# Altium schematic sheet Zegar.SchDoc
size A3
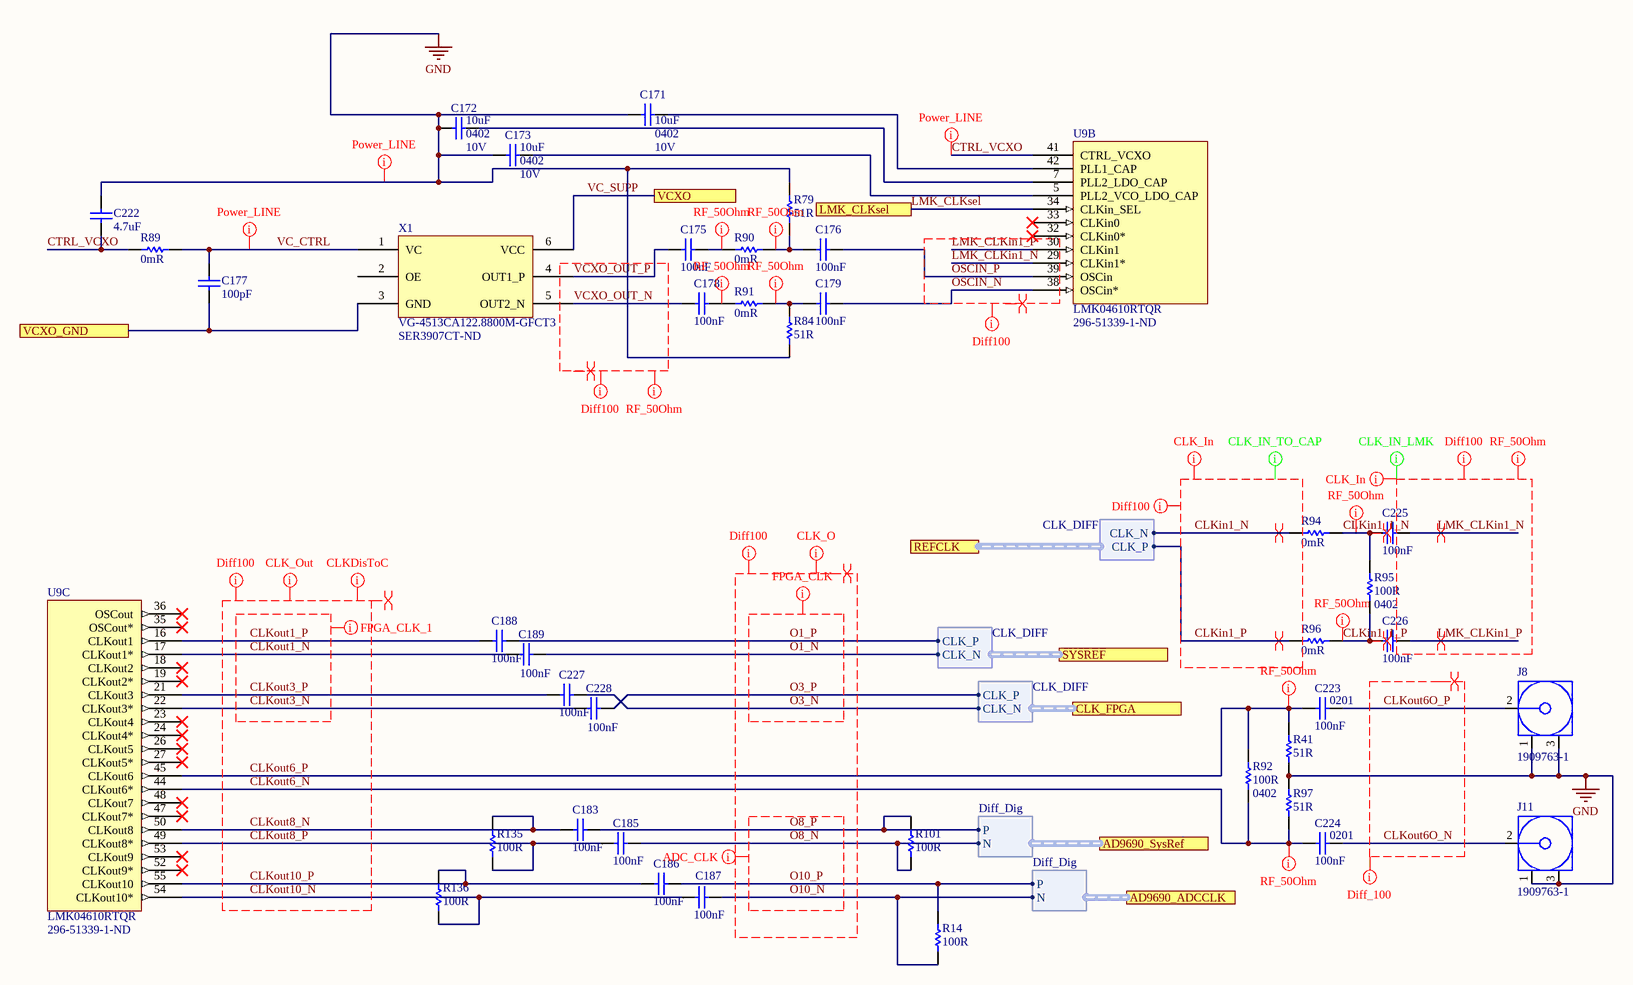
[diagram p0: Zegar.SchDoc]

## Parts
C171  10uF  Case/Package: 0402  Voltage Rating: 10V  [CAP 0402/1005 RF KK]
C172  10uF  Case/Package: 0402  Voltage Rating: 10V  [CAP 0402/1005 RF KK]
C173  10uF  Case/Package: 0402  Voltage Rating: 10V  [CAP 0402/1005 RF KK]
C175  100nF  [CAP 0201/0603 KK]
C176  100nF  [CAP 0201/0603 KK]
C177  100pF  [CAP 0402/1005 RF KK]
C178  100nF  [CAP 0201/0603 KK]
C179  100nF  [CAP 0201/0603 KK]
C183  100nF  [CAP 0201/0603 KK]
C185  100nF  [CAP 0201/0603 KK]
C186  100nF  [CAP 0201/0603 KK]
C187  100nF  [CAP 0201/0603 KK]
C188  100nF  [CAP 0201/0603 KK]
C189  100nF  [CAP 0201/0603 KK]
C222  4.7uF  [CAP 0603/1608 RF]
C223  100nF  Case Code (Imperial): 0201  [CAP 0201/0603 KK]
C224  100nF  Case Code (Imperial): 0201  [CAP 0201/0603 KK]
C225  100nF  [CAP 0201/0603 KK]
C226  100nF  [CAP 0201/0603 KK]
C227  100nF  [CAP 0201/0603 KK]
C228  100nF  [CAP 0201/0603 KK]
J8  1909763-1  [TECO-1909763-1_V]
J11  1909763-1  [TECO-1909763-1_V]
R14  100R  [RES 0201/0603]
R41  51R  [RES 0402/1005 RF KK]
R79  51R  [RES 0402/1005 RF KK]
R84  51R  [RES 0402/1005 RF KK]
R89  0mR  [RES 0402/1005 RF KK]
R90  0mR  [RES 0402/1005 RF KK]
R91  0mR  [RES 0402/1005 RF KK]
R92  100R  Case/Package: 0402  [RES 0402/1005 RF KK]
R94  0mR  [RES 0402/1005 RF KK]
R95  100R  Case/Package: 0402  [RES 0402/1005 RF KK]
R96  0mR  [RES 0402/1005 RF KK]
R97  51R  [RES 0402/1005 RF KK]
R101  100R  [RES 0201/0603]
R135  100R  [RES 0201/0603]
R136  100R  [RES 0201/0603]
U9  LMK04610RTQR  Supplier Part Number 1: 296-51339-1-ND  [LMK04610]  (parts B,C of 4)
X1  VG-4513CA122.8800M-GFCT3  Supplier Part Number 1: SER3907CT-ND  [VG-4513CA]

## Ports
AD9690_ADCCLK (harness Diff_Dig), AD9690_SysRef (harness Diff_Dig), CLK_FPGA (harness CLK_DIFF), LMK_CLKsel, REFCLK (harness CLK_DIFF), SYSREF (harness CLK_DIFF), VCXO, VCXO_GND

## Harnesses
Diff_Dig: P, N
CLK_DIFF: CLK_P, CLK_N

## Nets
GND: C171.2 C172.2 C173.2 C222.2 J8.1 J8.3 J11.1 J11.3 R41.1 R79.2 R84.1 R97.1
CLKin1_1_N: C225.1 R94.2 R95.1
CLKin1_1_P: C226.1 R95.2 R96.2
CLKin1_N: R94.1 ; port REFCLK.CLK_N
CLKin1_P: R96.1 ; port REFCLK.CLK_P
CLKout1_N: C189.1 U9.17(CLKout1*)
CLKout1_P: C188.1 U9.16(CLKout1)
CLKout3_N: C228.1 U9.22(CLKout3*)
CLKout3_P: C227.1 U9.21(CLKout3)
CLKout6_N: C224.1 R92.2 R97.2 U9.44(CLKout6*)
CLKout6_P: C223.1 R41.2 R92.1 U9.45(CLKout6)
CLKout6O_N: C224.2 J11.2
CLKout6O_P: C223.2 J8.2
CLKout8_N: C183.1 R135.2 U9.50(CLKout8)
CLKout8_P: C185.1 R135.1 U9.49(CLKout8*)
CLKout10_N: C187.1 R136.1 U9.54(CLKout10*)
CLKout10_P: C186.1 R136.2 U9.55(CLKout10)
CTRL_VCXO: C222.1 R89.1 U9.41(CTRL_VCXO)
LMK_CLKin1_N: C225.2 U9.29(CLKin1*)
LMK_CLKin1_P: C226.2 U9.30(CLKin1)
LMK_CLKsel: U9.34(CLKin_SEL) ; port LMK_CLKsel
O1_N: C189.2 ; port SYSREF.CLK_N
O1_P: C188.2 ; port SYSREF.CLK_P
O3_N: C227.2 ; port CLK_FPGA.CLK_N
O3_P: C228.2 ; port CLK_FPGA.CLK_P
O8_N: C185.2 R101.1 ; port AD9690_SysRef.N
O8_P: C183.2 R101.2 ; port AD9690_SysRef.P
O10_N: C187.2 R14.1 ; port AD9690_ADCCLK.N
O10_P: C186.2 R14.2 ; port AD9690_ADCCLK.P
OSCIN_N: C179.2 U9.38(OSCin*)
OSCIN_P: C176.2 U9.39(OSCin)
VC_CTRL: C177.2 R89.2 X1.1(VC)
VC_SUPP: X1.6(VCC) ; port VCXO
VCXO_GND: C177.1 X1.3(GND) ; port VCXO_GND
VCXO_OUT_N: C178.1 X1.5(OUT2_N)
VCXO_OUT_P: C175.1 X1.4(OUT1_P)
NetC171_1: C171.1 U9.42(PLL1_CAP)
NetC172_1: C172.1 U9.7(PLL2_LDO_CAP)
NetC173_1: C173.1 U9.5(PLL2_VCO_LDO_CAP)
NetC175_2: C175.2 R90.1
NetC176_1: C176.1 R79.1 R90.2
NetC178_2: C178.2 R91.1
NetC179_1: C179.1 R84.2 R91.2

Not connected (* = marked no-connect by the designer): U9 18(CLKout2)* 19(CLKout2*)* 23(CLKout4)* 24(CLKout4*)* 26(CLKout5)* 27(CLKout5*)* 32(CLKin0*)* 33(CLKin0)* 35(OSCout*)* 36(OSCout)* 47(CLKout7*)* 48(CLKout7)* 52(CLKout9*)* 53(CLKout9)*; X1 2(OE)

## Layout directives
net class CLK_IN1: CLKin1_N, CLKin1_P
net class CLK_IN2: LMK_CLKin1_N, LMK_CLKin1_P
net class CLK_O: O1_N, O1_P, O3_N, O3_P, O8_N, O8_P, O10_N, O10_P
net class ADC_CLK: O8_N, O8_P, O10_N, O10_P
net class Diff_100: CLKin1_N, CLKin1_P, CLKout1_N, CLKout1_P, CLKout3_N, CLKout3_P, CLKout6_N, CLKout6_P, CLKout6O_N, CLKout6O_P, CLKout8_N, CLKout8_P, CLKout10_N, CLKout10_P, LMK_CLKin1_N, LMK_CLKin1_P, O1_N, O1_P, O3_N, O3_P, O8_N, O8_P, O10_N, O10_P, OSCIN_N, OSCIN_P, VCXO_OUT_N, VCXO_OUT_P
net class CLK_Out: CLKout1_N, CLKout1_P, CLKout3_N, CLKout3_P, CLKout6_N, CLKout6_P, CLKout8_N, CLKout8_P, CLKout10_N, CLKout10_P
net class CLKDisToC: CLKout1_N, CLKout1_P, CLKout3_N, CLKout3_P, CLKout6_N, CLKout6_P, CLKout8_N, CLKout8_P, CLKout10_N, CLKout10_P
net class Power_LINE: CTRL_VCXO, GND, VC_CTRL
net class CLK_IN_TO_CAP: CLKin1_N, CLKin1_P
net class CLK_IN_LMK: LMK_CLKin1_N, LMK_CLKin1_P
differential pair; differential pair class Diff_100: CLKin1_1_N, CLKin1_1_P, CLKin1_N, CLKin1_P, CLKout1_N, CLKout1_P, CLKout3_N, CLKout3_P, CLKout6_N, CLKout6_P, CLKout6O_N, CLKout6O_P, CLKout8_N, CLKout8_P, CLKout10_N, CLKout10_P, LMK_CLKin1_N, LMK_CLKin1_P, O1_N, O1_P, O3_N, O3_P, O8_N, O8_P, O10_N, O10_P, OSCIN_N, OSCIN_P, VCXO_OUT_N, VCXO_OUT_P
net class FPGA_CLK: O1_N, O1_P, O3_N, O3_P
net class Single50: CLKin1_1_N, CLKin1_1_P, CLKout6_N, CLKout6_P, LMK_CLKin1_N, LMK_CLKin1_P, NetC175_2, NetC176_1, NetC178_2, NetC179_1, VCXO_OUT_N, VCXO_OUT_P
net class FPGA_CLK_1: CLKout1_N, CLKout1_P, CLKout3_N, CLKout3_P

## Notes on the sheet
- Title
- Size:
- Date:
- A3
- Number:
- Time:
- Revision:
- Sheet
- of
- File:

## Library data of the parts
C171-C173 = Capacitor: CAP CER 10UF 10V X5R 0402; Manufacturer: Samsung; Manufacturer Part Number: CL05A106MP8NUB8; Tolerance: 20%; Supplier 1: Digi-Key; Supplier Part Number 1: 1276-6830-1-ND; RoHS: Yes; Category: Ceramic Capacitors; Stock 1: 1457006; Pricing 1: 1=0,40000, 10=0,27900, 50=0,19500, 100=0,16710, 500=0,12534, 1000=0,10584, 2500=0,10027 (USD); Mount: Surface Mount; Case Code (Metric): 1005; Case Code (Imperial): 0402; Min Operating Temperature: -55°C; Max Operating Temperature: 85°C; Packaging: Tape and Reel; Capacitance: 10uF; Length: 0.039inch; Width: 0.02inch; Thickness: 0.035inch; ComponentLink1URL: http://www.samsungsem.com/kr/support/product-search/mlcc/CL05A106MP8NUB8.jsp?src-supplier=Digi-Key; ComponentLink1Description: http://www.samsungsem.com/kr/support/product-search/mlcc/CL05A106MP8NUB8.jsp?src-supplier=Digi-Key
C175 C176 C178 C179 C183 C185-C189 C223-C228 = Capacitor: Manufacturer 1: Yageo; Manufacturer Part Number 1: CC0201KRX5R6BB104; Voltage Rating (DC): 10V; Tolerance: 10%; Dielectric: X5R; Supplier 1: Digi-Key; Supplier Part Number 1: 311-1593-1-ND; Stock 1: 1229391; Pricing 1: 1=0.10000, 10=0.03800, 100=0.01690, 500=0.01208, 1000=0.00949, 2500=0.00862, 5000=0.00794 (USD); RoHS: Yes; Mount: Surface Mount; Case/Package: 0201; Weight: 6E-06oz; Case Code (Metric): 0603; Min Operating Temperature: -55°C; Max Operating Temperature: 85°C; Capacitance: 100nF; Packaging: Tape and Reel; Termination: SMD/SMT; Composition: Ceramic; Voltage Rating: 10V; Length: 0.6mm; Height: 0.3mm; Width: 0.012inch; Thickness: 0.013inch; Depth: 0.3mm; Radiation Hardening: No; Lead Free: Lead Free; Halogen Free: Halogen Free; ComponentLink1URL: https://datasheet.ciiva.com/17437/upy-gphc-x5r-4v-to-50v-12-17437495.pdf?src-supplier=Avnet+Europe; ComponentLink1Description: https://datasheet.ciiva.com/17437/upy-gphc-x5r-4v-to-50v-12-17437495.pdf?src-supplier=Avnet+Europe; ComponentLink2URL: https://datasheet.ciiva.com/11587/upy-gphc-x5r-4v-to-50v-12-11587190.pdf?src-supplier=Avnet; ComponentLink2Description: https://datasheet.ciiva.com/11587/upy-gphc-x5r-4v-to-50v-12-11587190.pdf?src-supplier=Avnet
  C175 C176 C178 C179 C183 C185-C189 C225-C228: Case Code (Imperial): 0201
C177 = Capacitor: Manufacturer 1: KEMET; Manufacturer Part Number 1: C0402C101J5GACAUTO; Dielectric Material: Ceramic; Tolerance: 5%; Voltage Rating: 50V; Dielectric: C0G; Supplier 1: Digi-Key; Supplier Part Number 1: 399-6823-1-ND; Stock 1: 66452; Pricing 1: 1=0.11000, 10=0.08400, 100=0.03730, 500=0.02664, 1000=0.02093, 2500=0.01903, 5000=0.01751 (USD); RoHS: Yes; Mount: Surface Mount; Case/Package: 0402; Case Code (Metric): 1005; Case Code (Imperial): 0402; Min Operating Temperature: -55°C; Max Operating Temperature: 125°C; Package Quantity: 10000; Capacitance: 100pF; Packaging: Tape and Reel; Voltage Rating (DC): 50V; Length: 1mm; Width: 0.02inch; Thickness: 0.022inch; Depth: 0.5mm; Ratings: AEC-Q200; Radiation Hardening: No; REACH SVHC: No SVHC; Lead Free: Lead Free; ComponentLink1URL: https://datasheet.ciiva.com/26923/getdatasheetpartid-385375-26923866.pdf?src-supplier=Verical; ComponentLink1Description: https://datasheet.ciiva.com/26923/getdatasheetpartid-385375-26923866.pdf?src-supplier=Verical
C222 = Capacitor: Manufacturer 1: Samsung; Manufacturer Part Number 1: CL10A475KQ8NNNC; Material: Ceramic; Tolerance: 20%; Voltage Rating: 6.3V; Dielectric: X5R; Supplier 1: Digi-Key; Supplier Part Number 1: 1276-1045-1-ND; Stock 1: 3419762; Pricing 1: 1=0.10000, 10=0.05500, 100=0.02450, 500=0.01750, 1000=0.01375 (USD); RoHS: Yes; Mount: Surface Mount; Case/Package: 0603; Case Code (Metric): 1608; Case Code (Imperial): 0603; Contact Plating: Tin; Min Operating Temperature: -55°C; Max Operating Temperature: 85°C; Capacitance: 4.7uF; Packaging: Tape and Reel; Package Quantity: 1; Voltage: 6.3V; Length: 1.6mm; Height: 0.8mm; Width: 0.031inch; Thickness: 0.035inch; Depth: 0.8mm; Radiation Hardening: No; ComponentLink1URL: https://datasheet.ciiva.com/15195/getdatasheetpartid-358620-15195714.pdf?src-supplier=Verical; ComponentLink1Description: https://datasheet.ciiva.com/15195/getdatasheetpartid-358620-15195714.pdf?src-supplier=Verical; ComponentLink2URL: https://datasheet.ciiva.com/29198/457675-da-01-en-vs-kondensator-0603-29198672.pdf?src-supplier=Conrad; ComponentLink2Description: https://datasheet.ciiva.com/29198/457675-da-01-en-vs-kondensator-0603-29198672.pdf?src-supplier=Conrad; ComponentLink3URL: https://datasheet.ciiva.com/16437/cl05b104kq5nnnc-16437321.pdf?src-supplier=Future+Electronics; ComponentLink3Description: https://datasheet.ciiva.com/16437/cl05b104kq5nnnc-16437321.pdf?src-supplier=Future+Electronics
J8 J11 = 1909763-1: Ultra Miniature Coaxial Connector Jack, 60 V, 50 Ohm, -40 to 90 degC, RoHS, Tape and Reel; Brand: TE Connectivity / AMP; Maximum Frequency: 6 GHz; Gender: Jack (Female); Body Material: Liquid Crystal Polymer (LCP); RF Series: UMCC; Impedance: 50 Ohms; DatasheetVersion: Rev. B2; PackageReference: SMD; PackageDescription: 3-Pin Surface Mount Device, Body 2.6 x 2.6 mm; Supplier 1: Newark; Supplier Part Number 1: 62X0488; Supplier 2: Farnell; Supplier Part Number 2: 2781689; Supplier 3: Digi-Key; Supplier Part Number 3: A118077TR-ND; Supplier 4: Digi-Key; Supplier Part Number 4: A118077CT-ND; Supplier 5: Digi-Key; Supplier Part Number 5: A118077DKR-ND; Product Category: RF Connectors / Coaxial Connectors; Packaging: Reel; Product: Connectors; Orientation: Straight; Operating Temperature Range: - 40 C to + 90 C; Factory Pack Quantity: 5000; RoHS: Details; Contact Plating: Gold; Contact Material: Copper Alloy; Mounting Technology: Surface Mount; ComponentLink1Description: Manufacturer URL; ComponentLink1URL: http://www.te.com; ComponentLink2Description: Datasheet; ComponentLink2URL: http://www.te.com/commerce/DocumentDelivery/DDEController?Action=srchrtrv&DocNm=1909763&DocType=Customer+Drawing&DocLang=English
R14 R101 R135 R136 = Resistor: Manufacturer 1: Panasonic; Manufacturer Part Number 1: ERJ-1GEF1000C; Tolerance: 1%; Power Rating: 50mW; Voltage Rating: 25V; Temperature Coefficient: 200ppm/°C; Voltage Rating (DC): 15V; Supplier 1: Mouser; Supplier Part Number 1: 667-ERJ-1GEF1000C; Stock 1: 517; Pricing 1: 1=0.10000, 10=0.03100, 100=0.01400, 1000=0.01000, 5000=0.00700, 10000=0.00600 (USD); RoHS: Yes; Mount: Surface Mount; Case/Package: 0201; Case Code (Metric): 0603; Case Code (Imperial): 0201; Contact Plating: Tin; Min Operating Temperature: -55°C; Max Operating Temperature: 125°C; Resistance: 100R; Packaging: Tape and Reel; Package Quantity: 15000; Composition: Thick Film; Number of Terminations: 2; Termination: SMD/SMT; Military Standard: Not; Max Power Dissipation: 50mW; Length: 0.6mm; Height: 0.23mm; Width: 0.012inch; Depth: 0.3mm; REACH SVHC: Unknown; Lead Free: Lead Free; ComponentLink1URL: https://datasheet.ciiva.com/16427/erj-1gef1000c-16427637.pdf?src-supplier=Future+Electronics; ComponentLink1Description: https://datasheet.ciiva.com/16427/erj-1gef1000c-16427637.pdf?src-supplier=Future+Electronics; ComponentLink2URL: https://datasheet.ciiva.com/16766/70260683-16766261.pdf?src-supplier=Allied+Electronics; ComponentLink2Description: https://datasheet.ciiva.com/16766/70260683-16766261.pdf?src-supplier=Allied+Electronics; ComponentLink3URL: https://datasheet.ciiva.com/16776/70260683-16776517.pdf?src-supplier=Allied+Electronics; ComponentLink3Description: https://datasheet.ciiva.com/16776/70260683-16776517.pdf?src-supplier=Allied+Electronics; ComponentLink4URL: https://datasheet.ciiva.com/7830/1678796-7830951.pdf?src-supplier=Element14; ComponentLink4Description: https://datasheet.ciiva.com/7830/1678796-7830951.pdf?src-supplier=Element14
R41 R79 R84 R97 = Resistor: Manufacturer 1: Susumu; Manufacturer Part Number 1: RR0510R-510-D; Tolerance: 0.5%; Power Rating: 63mW; Voltage Rating: 25V; Temperature Coefficient: 100ppm/°C; Supplier 1: Digi-Key; Supplier Part Number 1: RR05R51DCT-ND; Stock 1: 85168; Pricing 1: 1=0.10000, 10=0.07400, 100=0.02850, 1000=0.01254, 2500=0.01083, 5000=0.00969 (USD); RoHS: Yes; Case/Package: 0402; Number of Pins: 2; Case Code (Metric): 1005; Case Code (Imperial): 0402; Min Operating Temperature: -55°C; Max Operating Temperature: 125°C; Resistance: 51R; Package Quantity: 1; Packaging: Tape and Reel; Composition: Thin Film; Number of Terminations: 2; Termination: SMD/SMT; Max Power Dissipation: 63mW; Voltage Rating (DC): 25V; Length: 0.039inch; Height: 0.016inch; Width: 0.02inch; REACH SVHC: Unknown; Lead Free: Lead Free; ComponentLink1URL: https://datasheet.ciiva.com/2486/rr-data-sheet-2486920.pdf?src-supplier=Digi-Key; ComponentLink1Description: https://datasheet.ciiva.com/2486/rr-data-sheet-2486920.pdf?src-supplier=Digi-Key; ComponentLink2URL: https://datasheet.ciiva.com/2486/rr-data-sheet-2486921.pdf?src-supplier=Digi-Key; ComponentLink2Description: https://datasheet.ciiva.com/2486/rr-data-sheet-2486921.pdf?src-supplier=Digi-Key; ComponentLink3URL: https://datasheet.ciiva.com/2486/rr-data-sheet-2486922.pdf?src-supplier=Digi-Key; ComponentLink3Description: https://datasheet.ciiva.com/2486/rr-data-sheet-2486922.pdf?src-supplier=Digi-Key; ComponentLink4URL: https://datasheet.ciiva.com/28635/87330-28635919.pdf?src-supplier=Element14; ComponentLink4Description: https://datasheet.ciiva.com/28635/87330-28635919.pdf?src-supplier=Element14
R89-R91 R94 R96 = Resistor: Manufacturer 1: Yageo; Manufacturer Part Number 1: RC0402JR-070RL; Power Rating: 62.5mW; Tolerance: 5%; Voltage Rating: 50V; Max Power Dissipation: 63mW; Temperature Coefficient: 200ppm/°C; Supplier 1: Digi-Key; Supplier Part Number 1: 311-0.0JRCT-ND; Stock 1: 69822252; Pricing 1: 1=0.10000, 10=0.01200, 25=0.00920, 50=0.00680, 100=0.00510, 250=0.00388, 500=0.00308, 1000=0.00227, 5000=0.00163 (USD); RoHS: Yes; Case/Package: 0402; Contact Plating: Tin,Matte; Case Code (Metric): 1005; Case Code (Imperial): 0402; Min Operating Temperature: -55°C; Max Operating Temperature: 155°C; Resistance: 0mR; Packaging: Tape and Reel; Composition: Thick Film; Package Quantity: 1; Number of Terminations: 2; Termination: SMD/SMT; Military Standard: Not; Features: Moisture Resistant; Length: 1mm; Height: 0.016inch; Width: 0.02inch; Depth: 0.5mm; Radiation Hardening: No; REACH SVHC: Unknown; Lead Free: Lead Free; ComponentLink1URL: https://datasheet.ciiva.com/2452/pyu-rc0402-51-rohs-l-6-2452608.pdf?src-supplier=Digi-Key; ComponentLink1Description: https://datasheet.ciiva.com/2452/pyu-rc0402-51-rohs-l-6-2452608.pdf?src-supplier=Digi-Key; ComponentLink2URL: https://datasheet.ciiva.com/11808/0900766b80c66297-11808195.pdf?src-supplier=RSComponents; ComponentLink2Description: https://datasheet.ciiva.com/11808/0900766b80c66297-11808195.pdf?src-supplier=RSComponents; ComponentLink3URL: https://datasheet.ciiva.com/2452/pyu-r-int-thick-7-2452609.pdf?src-supplier=Digi-Key; ComponentLink3Description: https://datasheet.ciiva.com/2452/pyu-r-int-thick-7-2452609.pdf?src-supplier=Digi-Key; ComponentLink4URL: https://datasheet.ciiva.com/22747/1018594-22747515.pdf?src-supplier=Element14; ComponentLink4Description: https://datasheet.ciiva.com/22747/1018594-22747515.pdf?src-supplier=Element14; ComponentLink5URL: https://datasheet.ciiva.com/7983/1018594-7983535.pdf?src-supplier=Element14; ComponentLink5Description: https://datasheet.ciiva.com/7983/1018594-7983535.pdf?src-supplier=Element14; ComponentLink6URL: https://datasheet.ciiva.com/2452/pyu-r-int-thick-7-2452610.pdf?src-supplier=Digi-Key; ComponentLink6Description: https://datasheet.ciiva.com/2452/pyu-r-int-thick-7-2452610.pdf?src-supplier=Digi-Key; ComponentLink7URL: https://datasheet.ciiva.com/8896/pyu-rc0402-51-rohs-l-6-8896201.pdf?src-supplier=Avnet; ComponentLink7Description: https://datasheet.ciiva.com/8896/pyu-rc0402-51-rohs-l-6-8896201.pdf?src-supplier=Avnet; ComponentLink8URL: https://datasheet.ciiva.com/28386/pyu-rc0402-51-rohs-l-6-28386633.pdf?src-supplier=Avnet+Europe; ComponentLink8Description: https://datasheet.ciiva.com/28386/pyu-rc0402-51-rohs-l-6-28386633.pdf?src-supplier=Avnet+Europe; ComponentLink9URL: https://datasheet.ciiva.com/15189/getdatasheetpartid-326379-15189533.pdf?src-supplier=Verical; ComponentLink9Description: https://datasheet.ciiva.com/15189/getdatasheetpartid-326379-15189533.pdf?src-supplier=Verical
R92 R95 = Resistor: YAGEO - RC0402FR-07100RL. - RES, THICK FILM, 100R, 1%, 0.0625W, 0402, REEL; Temperature Coefficient: 100ppm/°C; Power Rating: 62.5mW; Voltage Rating: 50V; Supplier 1: Digi-Key; Supplier Part Number 1: 311-100LRCT-ND; Manufacturer: Yageo; Manufacturer Part Number: RC0402FR-07100RL; RoHS: Yes; Category: Chip SMD Resistors; Stock 1: 31356128; Pricing 1: 1=0,10000, 10=0,01600, 100=0,00640, 1000=0,00289, 2500=0,00251, 5000=0,00207 (USD); Number of Pins: 2; Case Code (Imperial): 0402; Case Code (Metric): 1005; Min Operating Temperature: -55°C; Max Operating Temperature: 155°C; Military Standard: Not; Tolerance: 1%; Resistance: 100R; Packaging: Tape and Reel; Termination: SMD/SMT; Composition: Thick Film; Voltage Rating (DC): 50V; Length: 1mm; Height: 0.32mm; Depth: 0.5mm; Width: 0.5mm; Lead Free: Lead Free; REACH SVHC: No SVHC; ComponentLink1URL: https://datasheet.ciiva.com/7849/1784430-7849810.pdf?src-supplier=Element14; ComponentLink1Description: https://datasheet.ciiva.com/7849/1784430-7849810.pdf?src-supplier=Element14; ComponentLink2URL: https://datasheet.ciiva.com/11808/0900766b80c66297-11808765.pdf?src-supplier=RSComponents; ComponentLink2Description: https://datasheet.ciiva.com/11808/0900766b80c66297-11808765.pdf?src-supplier=RSComponents; ComponentLink3URL: https://datasheet.ciiva.com/16740/pyu-rc0402-51-rohs-l-6-r-16740566.pdf?src-supplier=Future+Electronics; ComponentLink3Description: https://datasheet.ciiva.com/16740/pyu-rc0402-51-rohs-l-6-r-16740566.pdf?src-supplier=Future+Electronics; ComponentLink4URL: https://datasheet.ciiva.com/15189/getdatasheetpartid-329466-15189335.pdf?src-supplier=Verical; ComponentLink4Description: https://datasheet.ciiva.com/15189/getdatasheetpartid-329466-15189335.pdf?src-supplier=Verical; ComponentLink5URL: https://datasheet.ciiva.com/28367/1018594-28367226.pdf?src-supplier=Element14; ComponentLink5Description: https://datasheet.ciiva.com/28367/1018594-28367226.pdf?src-supplier=Element14; ComponentLink6URL: https://datasheet.ciiva.com/12667/pyu-rc0402-51-rohs-l-6-r-12667957.pdf?src-supplier=Mouser; ComponentLink6Description: https://datasheet.ciiva.com/12667/pyu-rc0402-51-rohs-l-6-r-12667957.pdf?src-supplier=Mouser; ComponentLink7URL: https://datasheet.ciiva.com/22747/1018594-22747511.pdf?src-supplier=Element14; ComponentLink7Description: https://datasheet.ciiva.com/22747/1018594-22747511.pdf?src-supplier=Element14
U9 = LMK04610RTQR: Manufacturer: Texas Instruments; Number of Inputs: 2; Number of Outputs: 10; Supplier 1: Digi-Key; Manufacturer Part Number: LMK04610RTQR; Stock 1: 2022; Pricing 1: 1 = 20,47000, 10 = 18,87700, 100 = 16,11940, 500 = 14,63474 (USD); RoHS: No; Min Operating Temperature: -40°C; Max Operating Temperature: 85°C
X1 = VG-4513CA122.8800M-GFCT3: OSC VCXO 122.88MHZ LVPECL SMD; Manufacturer: Epson; Max Supply Current: 65mA; Supplier 1: Digi-Key; Manufacturer Part Number: VG-4513CA122.8800M-GFCT3; Stock 1: 438; Pricing 1: 1 = 9,91000, 10 = 9,29000, 50 = 8,97980, 100 = 8,67020 (USD); RoHS: Yes; Mount: Surface Mount; Case/Package: SMD/SMT; Min Operating Temperature: -40°C; Max Operating Temperature: 85°C; Packaging: Tape and Reel; Frequency: 122.88MHz; Length: 0.276inch; Height: 0.071inch; Width: 0.197inch; Lead Free: Lead Free; ComponentLink1URL: https://datasheet.ciiva.com/29626/vg-4513ca-partnumber-29626986.pdf?src-supplier=Digi-Key; ComponentLink1Description: https://datasheet.ciiva.com/29626/vg-4513ca-partnumber-29626986.pdf?src-supplier=Digi-Key; ComponentLink2URL: https://datasheet.ciiva.com/29626/vg-4513ca-partnumber-29626987.pdf?src-supplier=Digi-Key; ComponentLink2Description: https://datasheet.ciiva.com/29626/vg-4513ca-partnumber-29626987.pdf?src-supplier=Digi-Key; ComponentLink3URL: https://datasheet.ciiva.com/29626/076-vg-4513ca-cb-e13ya-29626988.pdf?src-supplier=Digi-Key; ComponentLink3Description: https://datasheet.ciiva.com/29626/076-vg-4513ca-cb-e13ya-29626988.pdf?src-supplier=Digi-Key